# Altium schematic sheet MD-ADC Feedback.SchDoc
size A; SheetNumber: 8; SheetTotal: 8
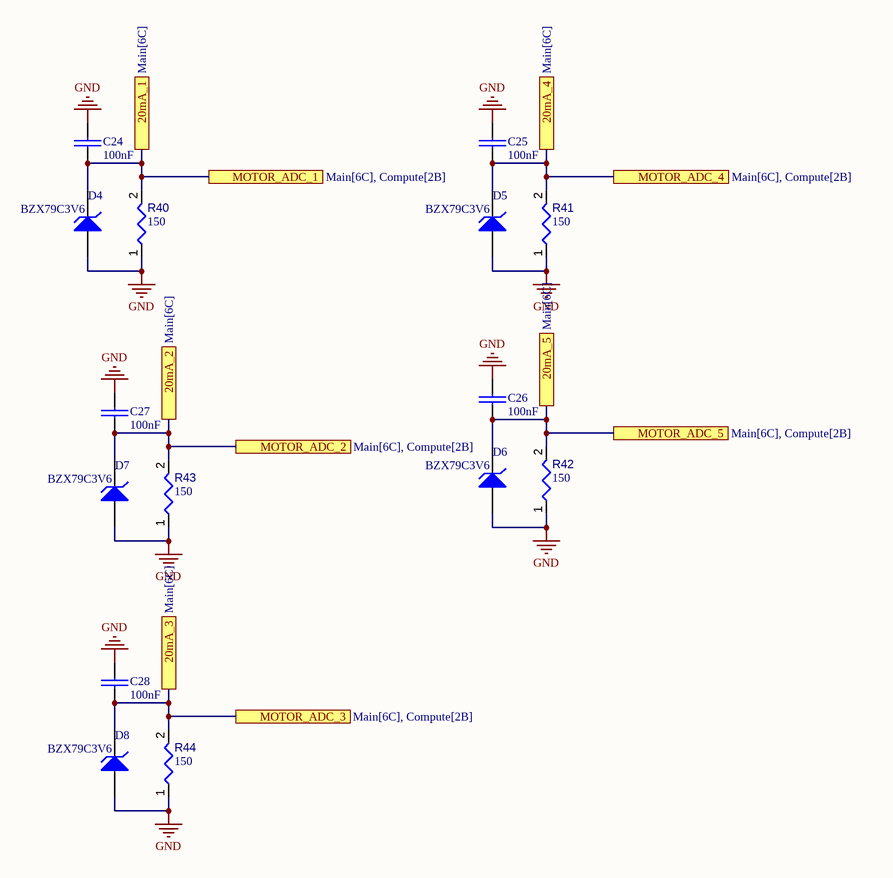
[diagram p0: MD-ADC Feedback.SchDoc]

## Parts
C24  value 100nF  [PCC-001-0014-1]  (hidden comment: Capacitor 82pF, 5%, 50V, C0G, 0603)
C25  value 100nF  [PCC-001-0014-1]  (hidden comment: Capacitor 82pF, 5%, 50V, C0G, 0603)
C26  value 100nF  [PCC-001-0014-1]  (hidden comment: Capacitor 82pF, 5%, 50V, C0G, 0603)
C27  value 100nF  [PCC-001-0014-1]  (hidden comment: Capacitor 82pF, 5%, 50V, C0G, 0603)
C28  value 100nF  [PCC-001-0014-1]  (hidden comment: Capacitor 82pF, 5%, 50V, C0G, 0603)
D4  BZX79C3V6  [FAIR-DO-35-2]
D5  BZX79C3V6  [FAIR-DO-35-2]
D6  BZX79C3V6  [FAIR-DO-35-2]
D7  BZX79C3V6  [FAIR-DO-35-2]
D8  BZX79C3V6  [FAIR-DO-35-2]
R40  value 150  [RESC0402(1005)_L]  (hidden comment: 316KR2F)
R41  value 150  [RESC0402(1005)_L]  (hidden comment: 316KR2F)
R42  value 150  [RESC0402(1005)_L]  (hidden comment: 316KR2F)
R43  value 150  [RESC0402(1005)_L]  (hidden comment: 316KR2F)
R44  value 150  [RESC0402(1005)_L]  (hidden comment: 316KR2F)

## Ports
20mA_1 (see Main[6C]), 20mA_2 (see Main[6C]), 20mA_3 (see Main[6C]), 20mA_4 (see Main[6C]), 20mA_5 (see Main[6C]), MOTOR_ADC_1 (see Main[6C], Compute[2B]), MOTOR_ADC_2 (see Main[6C], Compute[2B]), MOTOR_ADC_3 (see Main[6C], Compute[2B]), MOTOR_ADC_4 (see Main[6C], Compute[2B]), MOTOR_ADC_5 (see Main[6C], Compute[2B])

## Nets
GND: C24.1 C25.1 C26.1 C27.1 C28.1 D4.1(A) D5.1(A) D6.1(A) D7.1(A) D8.1(A) R40.1 R41.1 R42.1 R43.1 R44.1
20mA_1: C24.2 D4.2(K) R40.2 ; port 20mA_1, port MOTOR_ADC_1
20mA_2: C27.2 D7.2(K) R43.2 ; port 20mA_2, port MOTOR_ADC_2
20mA_3: C28.2 D8.2(K) R44.2 ; port 20mA_3, port MOTOR_ADC_3
20mA_4: C25.2 D5.2(K) R41.2 ; port 20mA_4, port MOTOR_ADC_4
20mA_5: C26.2 D6.2(K) R42.2 ; port 20mA_5, port MOTOR_ADC_5

## Library data of the parts
C24-C28 = Capacitor 82pF, 5%, 50V, C0G, 0603-1: Capacitor, ceramic, 82pF, 5%, 50V, C0G, 0603; Manufacturer 1: Samsung Electro-Mechanics; Manufacturer Part Number 1: CL10C820JB81PND; Supplier Part Number 1: 1276-CL10C820JB81PNDCT-ND; Supplier Part Number 2: C1683; Manufacturer 2: FH; Dielectric: C0G; Voltage: 50V; Manufacturer Part Number 2: 0603CG820J500NT; Supplier 1: DigiKey; Package: 0603; Tolerance: 5%; Supplier 2: LCSC
D4-D8 = CMP-004-00021-2: Zener Diode, 3.6 V, 5 mA, -65 to 200 degC, 2-Pin DO-35, RoHS, Bulk; Manufacturer: Fairchild Semiconductor; Tolerance: 6%; Power: 500mW; Forward Voltage: 1.5V; Impedance: 90Ohm; Package Quantity: 1000; Min Operating Temperature: -65°C; Datasheet Version: Rev. C1, 07/2007; Max Operating Temperature: 200°C; Mounting Technology: TH; Package Description: 2-Pin Through Hole Diode, Dia 1.72 mm, Body Length 3.805 mm; RoHS Compliant: True; Manufacturer URL: https://www.fairchildsemi.com/; Package Reference: DO-35-2; Case/Package: DO-35-2; Datasheet URL: https://www.fairchildsemi.com/datasheets/BZ/BZX79C3V6.pdf; Package URL: https://www.fairchildsemi.com/package-drawings/DO/DO35A.pdf; Pins: 2; Packaging: Bulk
R40-R44 = CMP-009-00093-2: 316K 0.063W 1% 0402 (1005 Metric)  SMD; Power: 63mW; Tolerance: 1%; Mounting Technology: SMT; Pins: 2; Case/Package: 0402